# EasyEDA Pro project ProProject_F4_2025-05-21.epro, schematic Schematic2
Create Date: 2024-12-11; Page Name: P1; Project Name: 25电赛备赛; Schematic Name: Schematic2; Update Date: 2024-12-12; Company: 嘉立创EDA; Page Size: A4; Version: V1.0
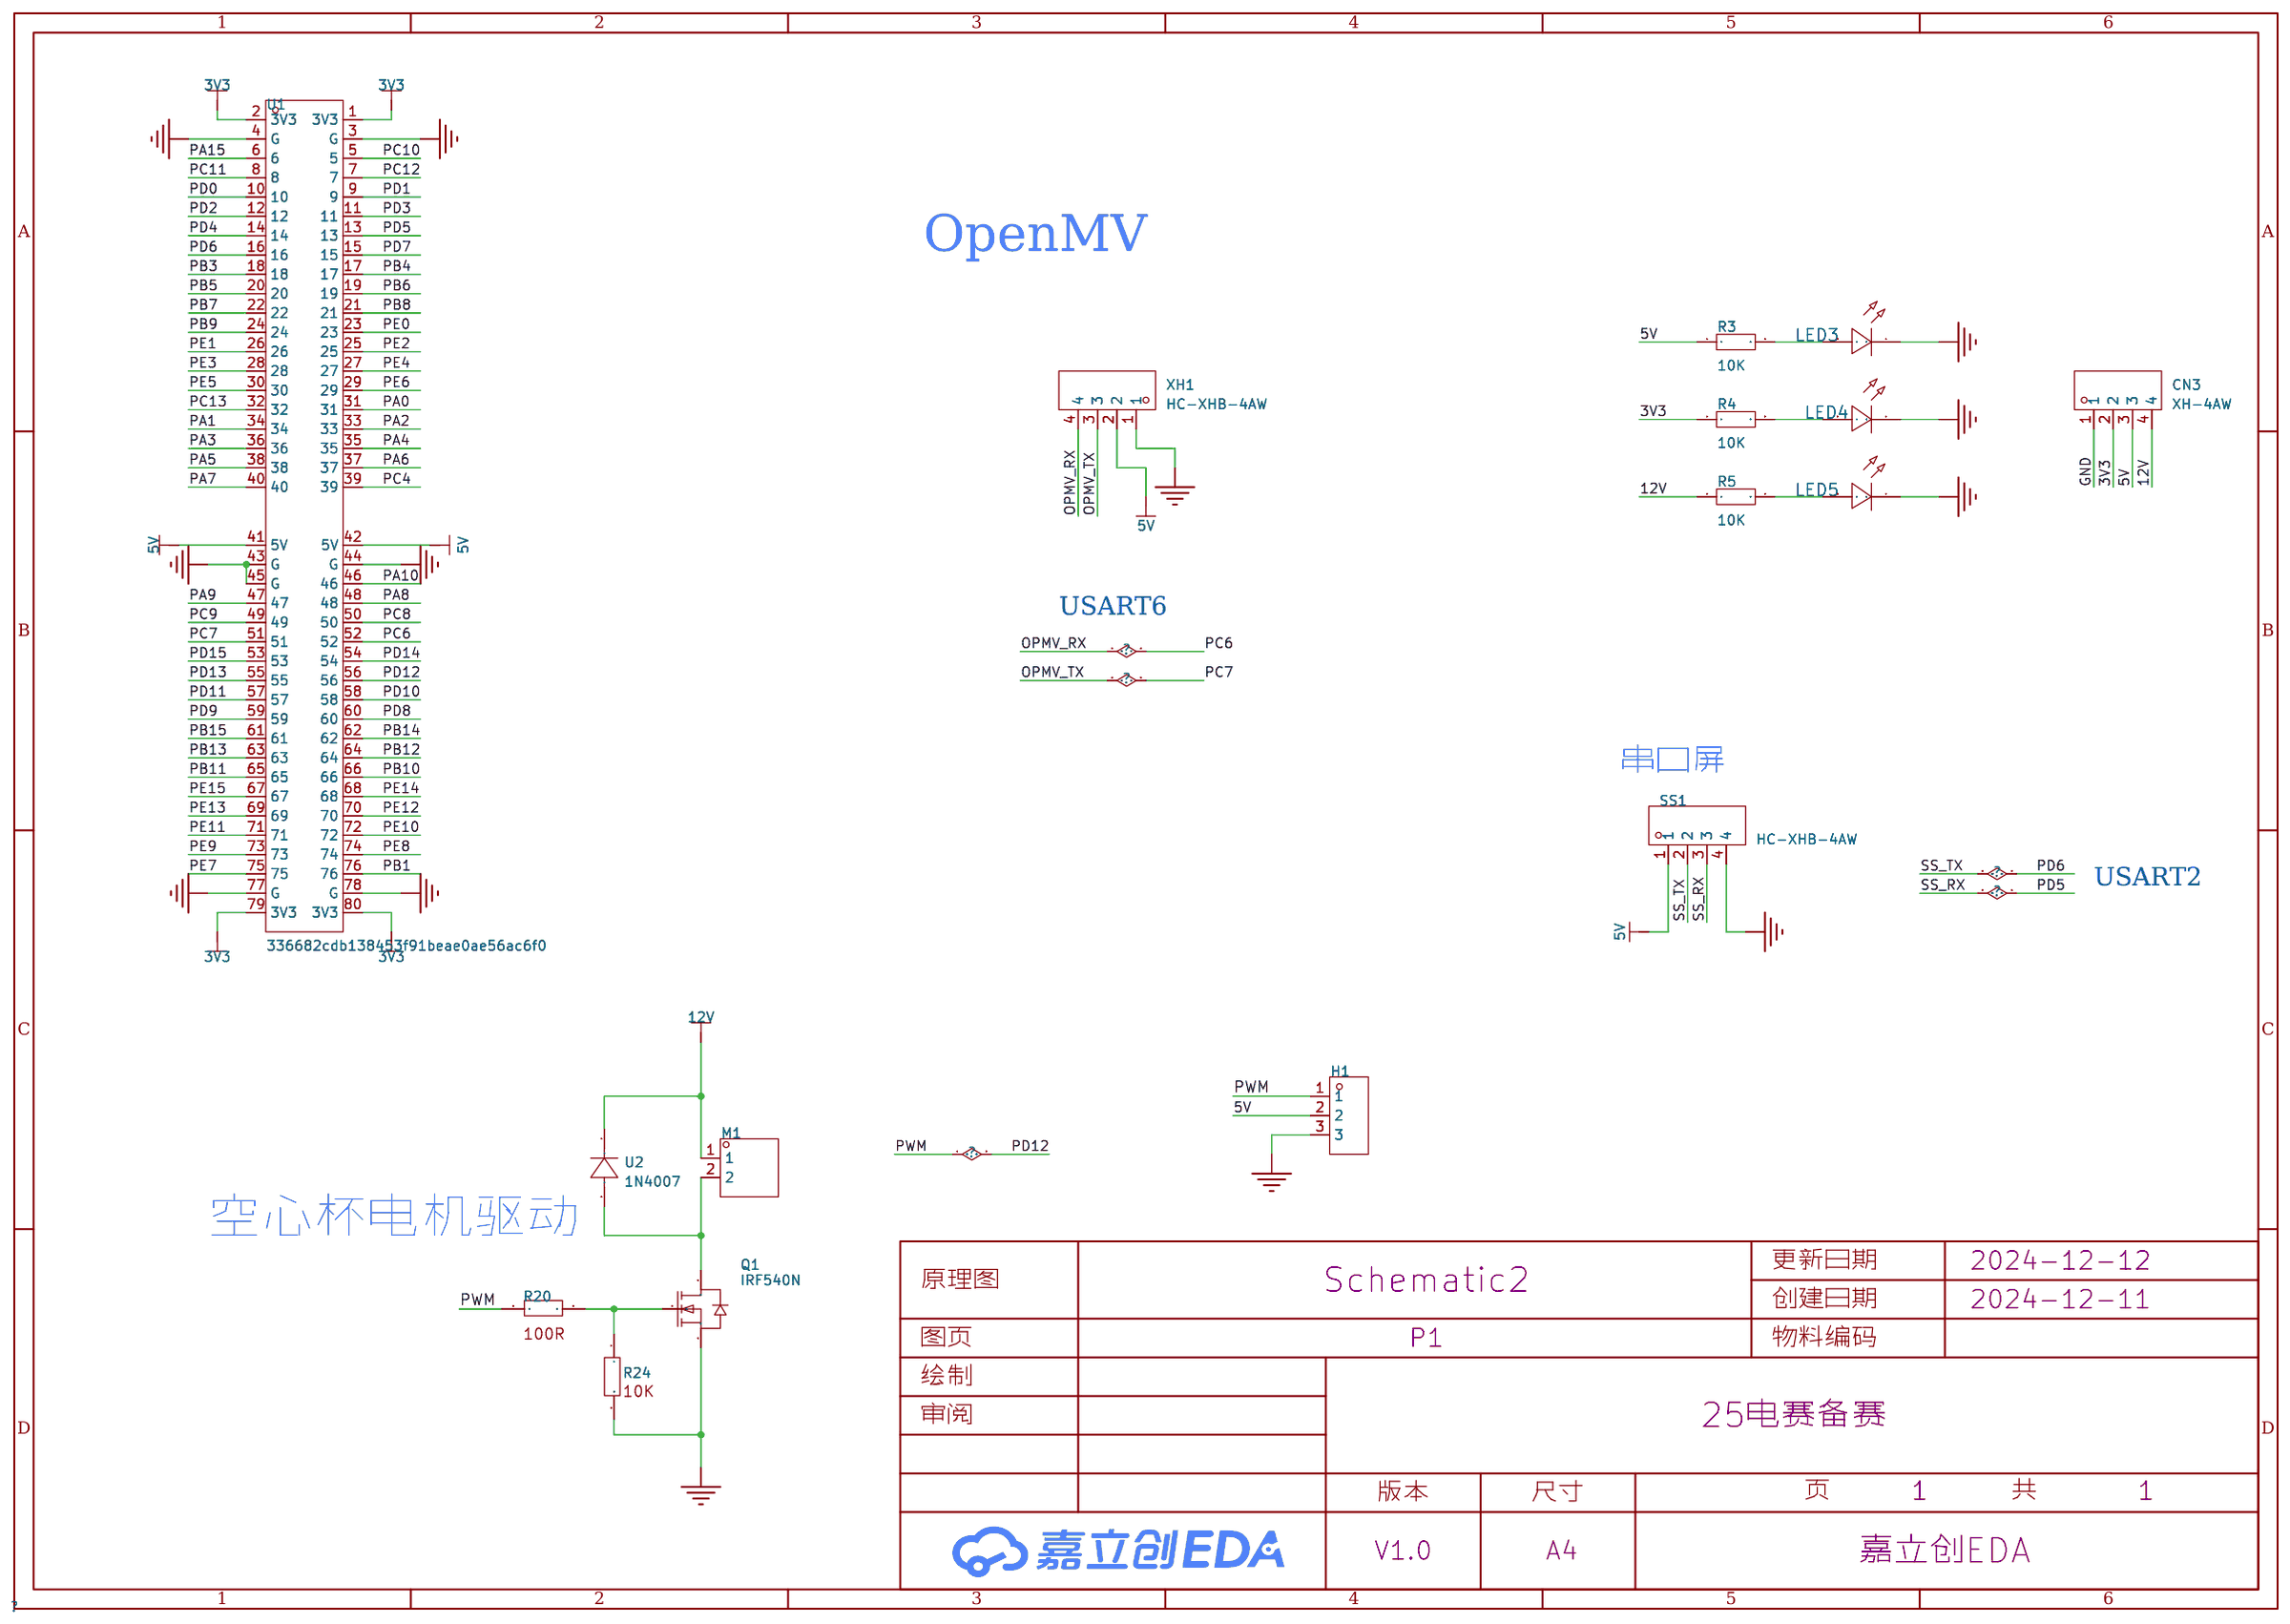
[diagram p0: schematic sheet]

## Parts
CN3  XH-4AW  [CONN-TH_XH-4AW]
H1  -  [HDR-TH_3P-P2.54-V-M]
LED3  -  [LED_0603]
LED4  -  [LED_0603]
LED5  -  [LED_0603]
M1  -  [HDR-TH_2P-P2.54-V-M-1]
Q1  IRF540N  [TO-220AB-3_L10.4-W4.6-P2.54-L]
R3  10K  [R0603]
R4  10K  [R0603]
R5  10K  [R0603]
R20  电阻  [r0603]
R24  电阻  [r0603]
SS1  HC-XHB-4AW  [CONN-TH_4P-P2.5_HCTL_HC-XHB-4AW]
U1  336682cdb138453f91beae0ae56ac6f0  [F4核心板]  (no BOM)
U2  1N4007  [SMA_L4.3-W2.6-LS5.1-RD]
XH1  HC-XHB-4AW  [CONN-TH_4P-P2.5_HCTL_HC-XHB-4AW]

## Library data of the parts
CN3 = XH-4AW: 插针结构:1x4P;间距:2.54mm;安装方式:弯插;参考系列:XH;总PIN数:4P;排数:1;每排PIN数:4;行距:-;额定电流:3A;触头材质:黄铜;触头镀层:锡;工作温度范围:-25℃~+85℃;; LCSC Part Name: 1x4P 间距:2.54mm 弯插 系列:XH; Supplier Part: C2908613; Manufacturer: HCTL(华灿天禄); Supplier Footprint: 弯插,P=2.54mm; JLCPCB Part Class: 扩展库; Datasheet: https://atta.szlcsc.com/upload/public/pdf/source/20230711/B565BAF3B11666EF6B81B3605408F2BD.pdf; Supplier: LCSC; Pins Structure: 1x4P; Pitch: 2.54mm; Mounting Style: 弯插; Reference Series: XH; Number of Pins: 4P; Number of Rows: 1; Number of PINs Per Row: 4; Current Rating (Max): 3A; Contact Material: 黄铜; Contact Plating: 锡; Operating Temperature Range: -25℃~+85℃
H1 = HDR-M_2.54_1x3P: Supplier Part: C2937625; Supplier Footprint: 插件
LED3-LED5 = LED_0603-R: Supplier Footprint: 0603
M1 = HDR-M_2.54_1x2P: Supplier Part: C124375; Supplier Footprint: 插件
Q1 = IRF540N: 类型:1个N沟道;漏源电压(Vdss):100V;连续漏极电流(Id):35A;导通电阻(RDS(on)@Vgs,Id):30mΩ@10V,12A;功率(Pd):70W;阈值电压(Vgs(th)@Id):4V@250uA;; LCSC Part Name: 1个N沟道 耐压:100V 电流:35A; Supplier Part: C5121605; Manufacturer: minos(迈诺斯); Supplier Footprint: TO-220; JLCPCB Part Class: 扩展库; Datasheet: https://atta.szlcsc.com/upload/public/pdf/source/20240829/B4C4E8C17A0FA094F66313BB46AAE7B7.pdf; Supplier: LCSC; Type: 1个N沟道; Drain Source Voltage (Vdss): 100V; Continuous Drain Current (Id): 35A; Drain Source On Resistance (RDS(on)@Vgs,Id): 30mΩ@10V,12A; Power Dissipation (Pd): 70W; Gate Threshold Voltage (Vgs(th)@Id): 4V@250uA; Total Gate Charge (Qg@Vgs): 55nC@10V; Input Capacitance (Ciss@Vds): 2.55nF@25V; Reverse Transfer Capacitance (Crss@Vds): 205pF@25V; Operating Temperature: -55℃~+175℃
R3-R5 = Res_0603: Supplier Footprint: 0603
R20 = 电阻: 阻值: 100R
R24 = 电阻: 阻值: 10K
SS1 XH1 = HC-XHB-4AW: 插针结构:1x4P;间距:2.5mm;安装方式:弯插;参考系列:-;总PIN数:4P;排数:1;每排PIN数:4;行距:-;额定电流:3A;触头材质:黄铜;触头镀层:锡;工作温度范围:-25℃~+85℃;; LCSC Part Name: 1x4P 间距:2.5mm 弯插; Supplier Part: C2845507; Manufacturer: HCTL(华灿天禄); Supplier Footprint: 弯插,P=2.5mm; Datasheet: https://atta.szlcsc.com/upload/public/pdf/source/20230711/E76CB2F3936D97053488B02AAFAB274A.pdf; Supplier: LCSC; Pins Structure: 1x4P; Pitch: 2.5mm; Mounting Style: 弯插; Number of Pins: 4P; Number of Rows: 1; Number of PINs Per Row: 4; Current Rating (Max): 3A; Contact Material: 黄铜; Contact Plating: 锡; Operating Temperature Range: -25℃~+85℃
U1 = F4核心板
U2 = 1N4007: Supplier Part: C9900004759; JLCPCB Part Class: 扩展库; Supplier: LCSC

## Nets
3V3: CN3.2 R4.1 U1.1(3V3) U1.2(3V3) U1.79(3V3) U1.80(3V3)
5V: CN3.3 H1.2 R3.1 SS1.1 U1.41(5V) U1.42(5V) XH1.2
12V: CN3.4 M1.1 R5.1 U2.1(K)
GND: CN3.1 H1.3 LED3.1(C) LED4.1(C) LED5.1(C) Q1.3(S) R24.2(0) SS1.4 U1.3(G) U1.4(G) U1.43(G) U1.44(G) U1.45(G) U1.77(G) U1.78(G) XH1.1
OPMV_RX: U1.52 XH1.4
OPMV_TX: U1.51 XH1.3
PA0: U1.31
PA1: U1.34
PA2: U1.33
PA3: U1.36
PA4: U1.35
PA5: U1.38
PA6: U1.37
PA7: U1.40
PA8: U1.48
PA9: U1.47
PA10: U1.46
PA15: U1.6
PB1: U1.76
PB3: U1.18
PB4: U1.17
PB5: U1.20
PB6: U1.19
PB7: U1.22
PB8: U1.21
PB9: U1.24
PB10: U1.66
PB11: U1.65
PB12: U1.64
PB13: U1.63
PB14: U1.62
PB15: U1.61
PC4: U1.39
PC8: U1.50
PC9: U1.49
PC10: U1.5
PC11: U1.8
PC12: U1.7
PC13: U1.32
PD0: U1.10
PD1: U1.9
PD2: U1.12
PD3: U1.11
PD4: U1.14
PD5: SS1.3 U1.13
PD6: SS1.2 U1.16
PD7: U1.15
PD8: U1.60
PD9: U1.59
PD10: U1.58
PD11: U1.57
PD12: H1.1 R20.1 U1.56
PD13: U1.55
PD14: U1.54
PD15: U1.53
PE0: U1.23
PE1: U1.26
PE2: U1.25
PE3: U1.28
PE4: U1.27
PE5: U1.30
PE6: U1.29
PE7: U1.75
PE8: U1.74
PE9: U1.73
PE10: U1.72
PE11: U1.71
PE12: U1.70
PE13: U1.69
PE14: U1.68
PE15: U1.67
$1N2654: LED4.2(A) R4.2
$1N2658: LED3.2(A) R3.2
$1N2670: LED5.2(A) R5.2
$1N3391: M1.2 Q1.2(D) U2.2(A)
$1N3394: Q1.1(G) R20.2(0) R24.1

## Notes on the sheet
- OpenMV
- USART6
- 串口屏
- USART2
- 空心杯电机驱动
